# Altium schematic sheet Sheet1.SchDoc
size A4; SheetNumber: 1; SheetTotal: 3
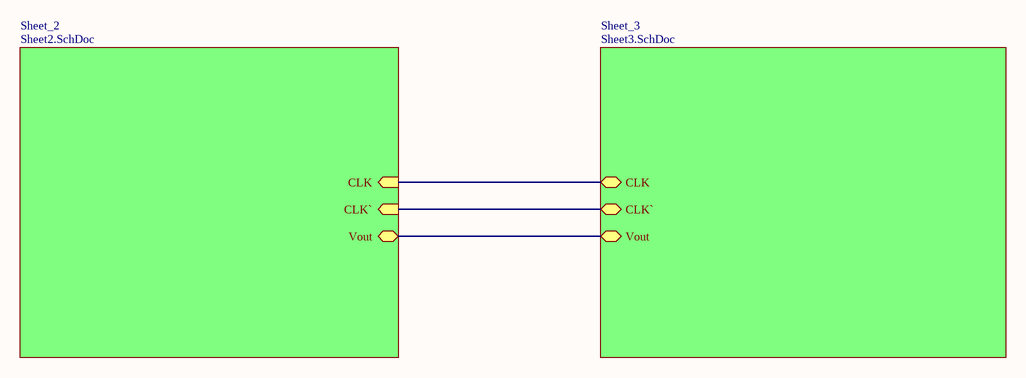
[diagram p0: Sheet1.SchDoc]

## Sub-sheets
Sheet_2 = Sheet2.SchDoc: CLK (in), CLK` (in), Vout (bidir)
Sheet_3 = Sheet3.SchDoc: CLK (bidir), CLK` (bidir), Vout (bidir)

## Nets
(unnamed): sheet Sheet_2/CLK, sheet Sheet_3/CLK
(unnamed): sheet Sheet_2/CLK`, sheet Sheet_3/CLK`
(unnamed): sheet Sheet_2/Vout, sheet Sheet_3/Vout